# Altium schematic sheet Load5.SchDoc
size A4; SheetNumber: 8; SheetTotal: 15
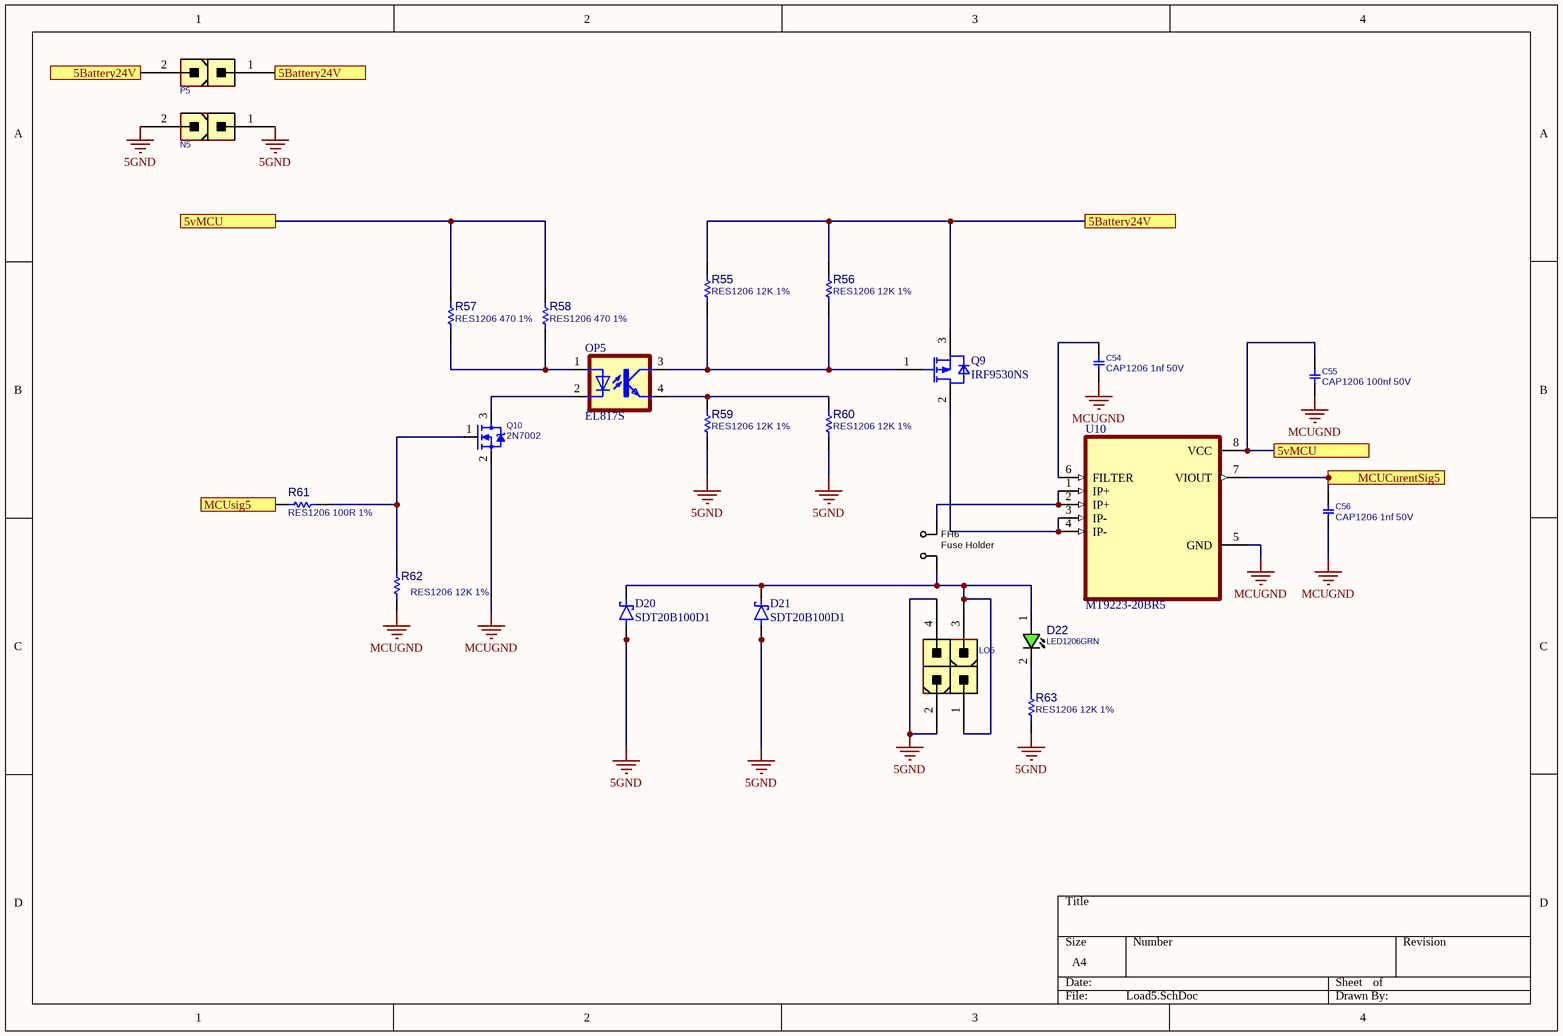
[diagram p0: Load5.SchDoc]

## Parts
C54  CAP1206 1nf 50V  [C1206]
C55  CAP1206 100nf 50V  [C1206]
C56  CAP1206 1nf 50V  [C1206]
D20  SDT20B100D1  [DPAK229P990X238-3N]
D21  SDT20B100D1  [DPAK229P990X238-3N]
D22  LED1206GRN  [LED1206GRN]
FH6  Fuse Holder  [FH_24101812]
LO5  CONN_ATXPWR_4  [ATXPWR_4]  (value not drawn)
N5  CONN_ATXPWR_2  [ATXPWR_2]  (value not drawn)
OP5  EL817S  [SOIC254P1030X460-4N]
P5  CONN_ATXPWR_2  [ATXPWR_2]  (value not drawn)
Q9  IRF9530NS  [TO254P1528X508-4_3N-V1]
Q10  2N7002  [SOT23_3]
R55  RES1206 12K 1%  [R1206]
R56  RES1206 12K 1%  [R1206]
R57  RES1206 470 1%  [R1206]
R58  RES1206 470 1%  [R1206]
R59  RES1206 12K 1%  [R1206]
R60  RES1206 12K 1%  [R1206]
R61  RES1206 100R 1%  [R1206]
R62  RES1206 12K 1%  [R1206]
R63  RES1206 12K 1%  [R1206]
U10  MT9223-20BR5  [SOIC127P600X175-8N]

## Ports
5Battery24V, 5vMCU, MCUCurentSig5, MCUsig5

## Nets
5GND: D20.1(A) D20.3(A__1) D21.1(A) D21.3(A__1) LO5.2 LO5.4 N5.1 N5.2 R59.2 R60.2 R63.2
MCUGND: C54.2 C55.2 C56.2 Q10.2(SOURCE) R62.2 U10.5(GND)
5Battery24V: P5.1 P5.2 Q9.3(SOURCE) R55.1 R56.1 ; port 5Battery24V
5vMCU: C55.1 R57.2 R58.2 U10.8(VCC) ; port 5vMCU
MCUCurentSig5: C56.1 U10.7(VIOUT) ; port MCUCurentSig5
MCUsig5: R61.1 ; port MCUsig5
NetC54_1: C54.1 U10.6(FILTER)
NetD20_4: D20.4(K) D21.4(K) D22.1(ANODE) FH6.1 LO5.1 LO5.3
NetD22_2: D22.2(CATHODE) R63.1
NetFH6_2: FH6.2 U10.1(IP+) U10.2(IP+)
NetOP5_1: OP5.1(A) R57.1 R58.1
NetOP5_2: OP5.2(C) Q10.3(DRAIN)
NetOP5_3: OP5.3(COL) Q9.1(GATE) R55.2 R56.2
NetOP5_4: OP5.4(EMIT) R59.1 R60.1
NetQ9_2: Q9.2(DRAIN) U10.3(IP-) U10.4(IP-)
NetQ10_1: Q10.1(GATE) R61.2 R62.1

## Library data of the parts
C54-C56 = CAP_SMD_MLCC_1206: CAP, MLCC; PARAM: -, -%; MANF_P#: MANF_PART#; PARAM2: -V; PRICE: 100= 1$; MANF: -; ASSEMBLY: ASSEMBLY
D20 D21 = MBRD835L: Diode Schottky 35 V 8A Surface Mount DPAK; MF: ON Semiconductor; SnapEDA_Link: https://www.snapeda.com/parts/MBRD835L/Onsemi/view-part/?ref=snap; Package: TO-252-3 MICROSS/On Semiconductor; Value: *; MP: MBRD835L; Check_prices: https://www.snapeda.com/parts/MBRD835L/Onsemi/view-part/?ref=eda
D22 = LED_SMD_1206_GRN: LED, SMD, 1206, GREEN; PARAM: 20mA; DESC: DESCRIPTION; PARAM2: 2.2V; MANF: -; ASSEMBLY: ASSEMBLY; PRICE: 36t@Javan; MANF_P#: -; VALUE: LED1206GRN; MountType: SMT; PartType: LED
FH6 = FUSE_SMD_HOLDER_24101812: Fuse SMD2410 Holder; PARAM: max. 10A; MANF: Littelfuse; MANF_P#: 01550900M; PARAM2: 125v; PRICE: 0.2$; PACKAGE: SMD,5.0x9.7mm; VALUE: Fuse Holder
LO5 = CONN_ATXPWR_4: CONN, ATX POWER, 4 P; MANF: TE, Molex; MANF_P#: 4-1775099-0, 39281043; VALUE: CONN_ATXPWR_4; MountType: THD; PACKAGE: ATXPWR-4pin; Part Type: Conn.
N5 P5 = CONN_ATXPWR_2: CONN, ATX POWER, 2 P; MANF: Molex; MANF_P#: 39281023; VALUE: CONN_ATXPWR_2; MountType: THD; PACKAGE: ATXPWR-2pin; Part Type: Conn.
OP5 = EL817S: Optoisolator Transistor Output 5000Vrms 1 Channel 4-SMD; MF: Everlight Electronics; SnapEDA_Link: https://www.snapeda.com/parts/EL817S/Everlight+Electronics+Co+Ltd/view-part/?ref=snap; Package: SMD-4 Everlight Electronics Co Ltd; Value: *; MP: EL817S; Check_prices: https://www.snapeda.com/parts/EL817S/Everlight+Electronics+Co+Ltd/view-part/?ref=eda
Q9 = IRF9530NS: OptiMOS - P2 Power-Transistor, P-channel-Enhancement mode, VDS -30V; Manufacturer: Infineon Technologies; Manufacturer Order NumberManufacturer Order Number: IRF9530NS; PackageReference: PG-TO263-3-901
Q10 = MOSN_2N7002_SOT23: MOSFET, N-CH, 60V, 0.3A; MANF: NXP; ASSEMBLY: ASSEMBLY; MANF_P#: 2N7002; PARAM2: 60v; PARAM: 0.3A; PRICE: 0.3t@Javan; VALUE: 2N7002
R55-R63 = RES_SMD_1206: RESISTOR, SMD; PARAM: 1%, 0.25W; DESC: DESCRIPTION; DIST#: MOUSER; MANF_P#: -; MANF: -; ASSEMBLY: ASSEMBLY; PRICE: -; PARAM2: -
U10 = ACS712ELCTR-05B-T: MF: {'manufacturer': u'Allegro MicroSystems'}; Package: None; Price: None; Value: *; MP: ACS712ELCTR-05B-T; Availability: Unavailable